# EasyEDA Pro project 辅助电源.epro, board 50W功率平板变压器
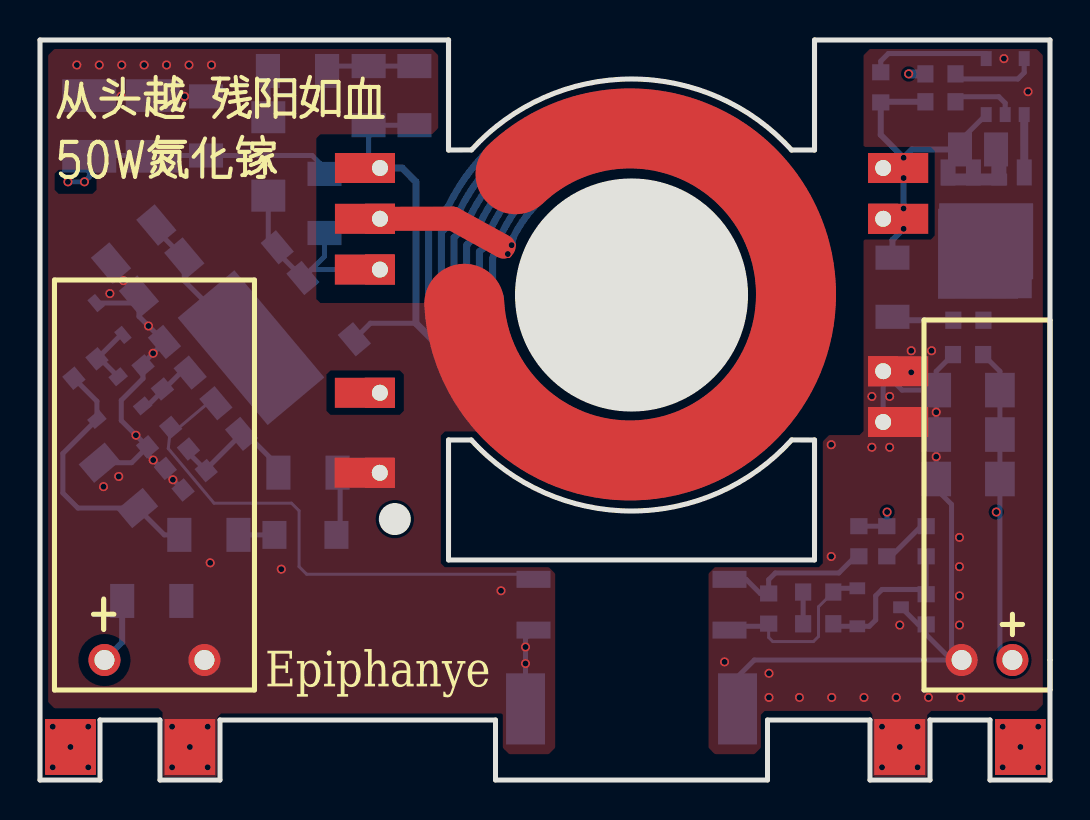
[diagram p5: board, top side]
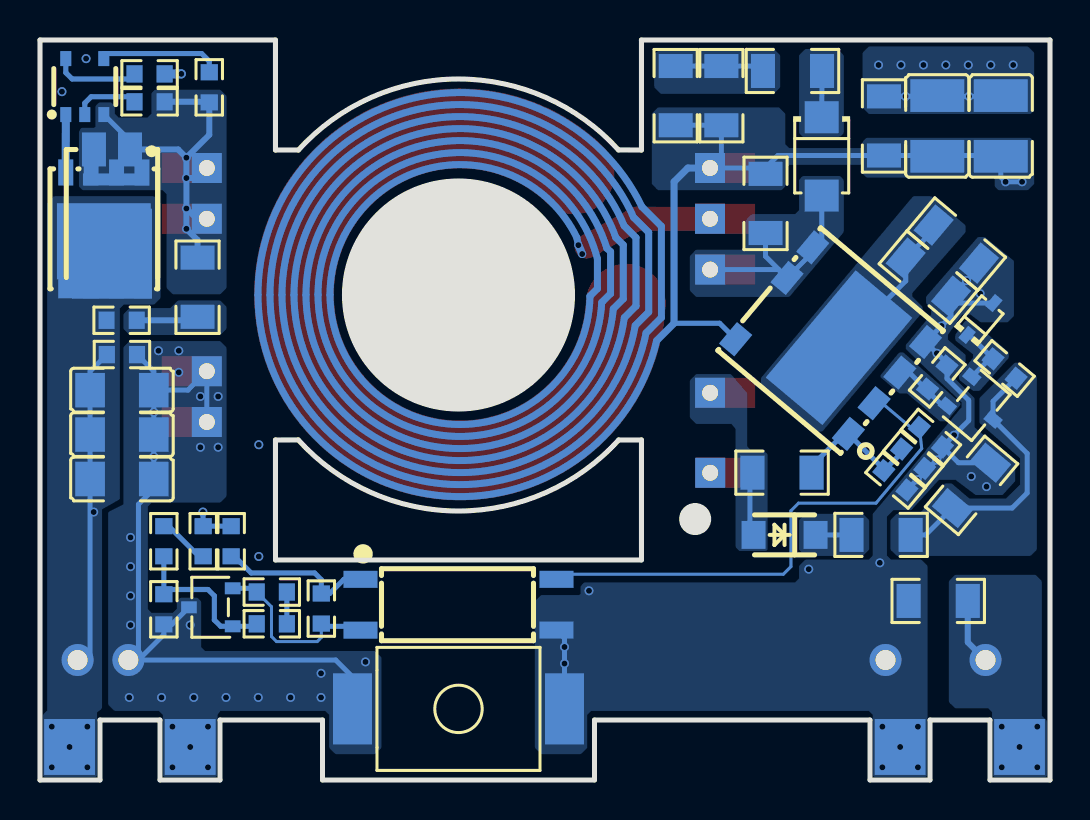
[diagram p6: board, bottom side, seen from below]

Outline 50.5 x 37 mm; copper layers: Top Layer, Inner1, Inner2, Bottom Layer. Coordinates in mm from the lower left corner of the outline.
Outline path: 20.43,37 0,37 0,0 3,0 3,3 6,3 6,0 9,0 9,3 22.78,3 22.78,0 36.38,0 36.38,3 41.5,3 41.5,0 44.5,0 44.5,3 47.5,3 47.5,0 50.5,0 50.5,37 38.73,37 ; 20.43,11.5 20.43,11 38.73,11 38.73,11.5
Stack: Top Layer 0.035mm / Dielectric1 0.48mm PP er 4.5 / Inner1 0.035mm / Dielectric2 0.48mm FR4 er 4.5 / Inner2 0.035mm / Dielectric3 0.48mm PP er 4.5 / Bottom Layer 0.035mm

## Design rules (mm)
spacing Default (default): track to track 0.25, other pairs 0 to 0.25
spacing Plane_Default: track to track 0.25, other pairs 0 to 0.25
spacing Copper_Default: track to track 0.25, other pairs 0 to 0.25
spacing Copper_gge74955: track to track 0.25, other pairs 0 to 0.25
spacing Copper_gge74970: track to track 0.25, other pairs 0 to 0.25
spacing Copper_gge74979: track to track 0.25, other pairs 0 to 0.25
spacing Copper_gge75000: track to track 0.25, other pairs 0 to 0.25
spacing Copper_gge75132: track to track 0.25, other pairs 0 to 0.25
spacing Copper_gge75177: track to track 0.25, other pairs 0 to 0.25
spacing Copper_gge75204: track to track 0.25, other pairs 0 to 0.25
spacing Copper_gge75213: track to track 0.25, other pairs 0 to 0.25
spacing Copper_gge75222: track to track 0.25, other pairs 0 to 0.25
spacing Copper_gge75285: track to track 0.25, other pairs 0 to 0.25
spacing Copper_gge75324: track to track 0.25, other pairs 0 to 0.25
spacing Copper_gge75474: track to track 0.25, other pairs 0 to 0.25
spacing Copper_gge75489: track to track 0.25, other pairs 0 to 0.25
spacing Copper_gge75615: track to track 0.25, other pairs 0 to 0.25
spacing Copper_gge90110: track to track 0.25, other pairs 0 to 0.25
spacing Copper_gge103059: track to track 0.25, other pairs 0 to 0.25
spacing Copper_gge103068: track to track 0.25, other pairs 0 to 0.25
spacing Copper_gge103143: track to track 0.25, other pairs 0 to 0.25
spacing Copper_gge82110: track to track 0.25, other pairs 0 to 0.25
spacing Copper_gge75918: track to track 0.25, other pairs 0 to 0.25
spacing Copper_gge83123: track to track 0.25, other pairs 0 to 0.25
spacing Copper_gge82110(1): track to track 0.25, other pairs 0 to 0.25
spacing Copper_gge75918(1): track to track 0.25, other pairs 0 to 0.25
spacing Copper_gge75918(2): track to track 0.25, other pairs 0 to 0.25
spacing Copper_gge82110(2): track to track 0.25, other pairs 0 to 0.25
track width Default (default): min 0.15, default 0.15, max 25.4
differential pair differentialPair (default): width min 0.127, default 0.254, max 2.54; gap min 0.152, default 0.152
pour e511 uses Copper_Default, gge74955
pour e513 uses Copper_Default, gge74970
pour e515 uses Copper_Default, gge74979
pour e517 uses Copper_Default, gge75000
pour e522 uses Copper_Default, gge75132
pour e526 uses Copper_Default, gge75177
pour e528 uses Copper_Default, gge75204
pour e530 uses Copper_Default, gge75213
pour e534 uses Copper_Default, gge75222
pour e536 uses Copper_Default, gge75285
pour e538 uses Copper_Default, gge75324
pour e544 uses Copper_Default, gge75474
pour e549 uses Copper_Default, gge75489
pour e560 uses Copper_Default, gge75615
pour e566 uses Copper_Default, gge90110
pour e568 uses Copper_Default, gge103059
pour e570 uses Copper_Default, gge103068
pour e578 uses Copper_Default, gge103143
pour e579 uses Copper_Default, gge82110
pour e588 uses Copper_Default, gge75918
pour e600 uses Copper_Default, gge83123
pour e606 uses Copper_Default, gge82110(1)
pour e616 uses Copper_Default, gge75918(1)
pour e628 uses Copper_Default, gge75918(2)
pour e640 uses Copper_Default, gge82110(2)

## Placement (name value [footprint] x y rotation side)
C4  33uF  [CAP-TH_BD10.0-P5.00-D1.0-FD-H18.8]  5.72 6 0 top
C5  470nF  [C1210]  2.46 32.7 270 bottom
C6  470nF  [C1210]  5.64 32.7 270 bottom
C7  1nF  [R0603]  46.42 22.99 180 bottom
C8  10uF  [C1206]  46.4 17.27 0 bottom
C9  10uF  [C1206]  46.4 19.49 0 bottom
C10  10uF  [C1206]  46.4 15.05 0 bottom
C11  1uF  [R0603]  46.4 21.27 180 bottom
C12  1nF  [R1206]  18.72 34.22 270 bottom
C13  22pF  [R1206]  14.22 28.83 90 bottom
C14  4.7uF  [R0603]  45.02 33.91 0 bottom
C15  680uF  [CAP-TH_BD6.3-P2.50-D1.0]  47.35 6 180 top
C16  1nF  [R0603]  5.95 17.14 220 bottom
C17  100nF  [R0603]  38.91 9.4 180 bottom
C18  NC  [R0603]  6.84 16.07 40 bottom
C19  10uF  [R0603]  5.64 20.13 310 bottom
D1  DK5V100R10S  [SM-7_L5.6-W4.1_DK5V100R10S]  46.9 28.92 90 bottom
D2  S2MF  [SMAF_L3.5-W2.6-LS4.7-RD]  11.41 31.18 270 bottom
D3  FR107W  [SOD-123FL_L2.8-W1.8-LS3.6-RD]  13.27 12.26 0 bottom
NOREF  -  [Pad_e96]  16.24 25.52 180 top
NOREF#2  -  [Pad_e94]  16.25 30.6 180 top
NOREF#3  -  [Pad_e92]  42.91 20.44 0 top
NOREF#4  -  [Pad_e82]  42.99 1.65 0 top
NOREF#5  -  [Pad_e98]  16.24 15.36 180 top
NOREF#6  -  [Pad_e84]  7.49 1.65 0 top
NOREF#7  -  [Pad_e87]  42.99 1.65 0 top
NOREF#8  -  [Pad_e93]  42.91 17.9 0 top
NOREF#9  -  [Pad_e88]  1.52 1.65 0 top
NOREF#10  -  [Pad_e85]  1.52 1.65 0 top
NOREF#11  -  [Pad_e91]  42.91 28.06 0 top
NOREF#12  -  [Pad_e95]  16.25 28.06 180 top
NOREF#13  -  [Pad_e97]  16.24 19.36 180 top
NOREF#14  -  [Pad_e90]  42.91 30.6 0 top
NOREF#15  -  [Pad_e89]  7.49 1.65 0 top
NOREF#16  -  [Pad_e83]  49.02 1.65 0 top
NOREF#17  -  [Pad_e86]  49.02 1.65 0 top
Q1  SS8050  [SOT-23-3_L2.9-W1.8-P1.90-LS2.4-BR]  3.68 18.73 40 bottom
R3  1MΩ  [R1206]  5.59 8.95 180 bottom
R4  1MΩ  [R1206]  8.3 32.7 270 bottom
R6  22Ω  [R1206]  42.62 24.64 270 bottom
R7  250kΩ  [R1206]  16.43 34.22 270 bottom
R8  20kΩ  [R0603]  42.04 34.63 270 bottom
R9  22Ω  [R1206]  12.88 35.45 180 bottom
R10  2.2Ω  [R0603]  45.02 35.31 180 bottom
R11  2.2kΩ  [R0603]  40.94 11.94 90 bottom
R12  4.7kΩ  [R0603]  36.43 8.57 90 bottom
R13  42.2kΩ  [R0603]  42.34 11.94 90 bottom
R14  10kΩ  [R0603]  38.91 7.81 180 bottom
R15  100kΩ  [R0603]  44.31 11.94 90 bottom
R16  20kΩ  [R0603]  44.31 8.53 90 bottom
R17  4.7Ω  [R1206]  8.45 12.26 180 bottom
R18  20kΩ  [R0603]  2.27 20.57 220 bottom
R19  330kΩ  [R1206]  13.4 15.37 0 bottom
R20  750mΩ  [R1206]  6.08 25.15 40 bottom
R21  560mΩ  [R1206]  4.68 26.8 40 bottom
R22  27kΩ  [R0603]  7.73 14.99 40 bottom
U2  1nF  [CAP-SMD_L8.0-W6.0-LS11.4]  29.58 3.56 180 bottom
U3  CJAC80SN10  [PG-TDSON-8-L5.5-W5.2-P1.27-LS6.4-BL]  47.31 27.56 0 bottom
U4  50W 平面变压器  [EQ2510_PCB]  29.58 24.25 0 top
U5  LP35116P  [PG-SOT23-5_L2.9-W1.6-P0.95-LS2.8-BR]  48.26 34.67 270 bottom
U6  EL1019(TA)-VG  [SOP-4_L7.5-W3.8-P2.54-LS10.2-TL]  29.58 8.76 180 bottom
U7  TL431  [SOT-23-3_L2.9-W1.8-P1.90-LS2.4-BR]  41.96 8.64 180 bottom
U8  DK065G  [PQFN-8_L8.0-W8.0_DK065G]  10.97 21.97 130 bottom
U9  10uF  [R1206]  3.92 14.73 310 bottom
Z1  BZT52C12V  [SOD-323_L1.7-W1.3-LS2.5-FD]  3.48 23.05 310 bottom

## Footprints (pads in the part's own frame, mm; a bottom-side part is the same pattern mirrored in y, then rotated)
C1206
  rect 1.485x1.728 smd: 1(-1.593,0) 2(1.593,0)
C1210
  rect 1.635x2.7 smd: 1(-1.518,0) 2(1.518,0)
CAP-SMD_L8.0-W6.0-LS11.4
  rect 1.95x3.556 smd: 1(-5.3,0) 2(5.3,0)
CAP-TH_BD6.3-P2.50-D1.0
  round 1.6 hole 1: 1(-1.27,0) 2(1.27,0)
CAP-TH_BD10.0-P5.00-D1.0-FD-H18.8
  round 1.6 hole 1: 1(-2.5,0) 2(2.5,0)
EQ2510_PCB
  rect 1.5x1.5 hole 0.8: 1(-12.576,6.351) 2(-12.576,3.811) 3(-12.581,1.271) 4(-12.586,-8.889) 5(-12.581,-4.889) 6(12.582,-6.349) 7(12.582,-3.809) 8(12.582,3.811) 9(12.582,6.351)
Pad_e82
  rect 2.54x2.794 smd far side: 1(0,0)
Pad_e83
  rect 2.54x2.794 smd far side: 1(0,0)
Pad_e84
  rect 2.54x2.794 smd far side: 1(0,0)
Pad_e85
  rect 2.54x2.794 smd far side: 1(0,0)
Pad_e86
  rect 2.54x2.794 smd: 1(0,0)
Pad_e87
  rect 2.54x2.794 smd: 1(0,0)
Pad_e88
  rect 2.54x2.794 smd: 1(0,0)
Pad_e89
  rect 2.54x2.794 smd: 1(0,0)
Pad_e90
  rect 3x1.5 smd: 3(0,0)
Pad_e91
  rect 3x1.5 smd: 3(0,0)
Pad_e92
  rect 3x1.5 smd: 3(0,0)
Pad_e93
  rect 3x1.5 smd: 3(0,0)
Pad_e94
  rect 3x1.5 smd: 3(0,0)
Pad_e95
  rect 3x1.5 smd: 3(0,0)
Pad_e96
  rect 3x1.5 smd: 3(0,0)
Pad_e97
  rect 3x1.5 smd: 3(0,0)
Pad_e98
  rect 3x1.5 smd: 3(0,0)
PG-SOT23-5_L2.9-W1.6-P0.95-LS2.8-BR
  rect 0.75x0.55 smd: 1(1.4,-0.95) 2(1.4,0) 3(1.4,0.95) 4(-1.4,0.95) 5(-1.4,-0.95)
PG-TDSON-8-L5.5-W5.2-P1.27-LS6.4-BL
  rect 0.75x1.3 smd: 1(-1.905,-2.82) 2(-0.635,-2.82) 3(0.635,-2.82) 4(1.905,-2.82) 5(1.905,2.82) 6(0.635,2.82) 7(-0.635,2.82) 8(-1.905,2.82)
  rect 3.3x0.6 smd: 3(-0.6,-2.469)
  rect 4.699x3.8 smd: 8(0,0.62)
PQFN-8_L8.0-W8.0_DK065G
  rect 1.4x1 smd: 1(-3,-3.68) 2(-1,-3.68) 3(1,-3.68) 4(3,-3.68) 5(3,3.68) 6(1,3.68) 7(-3,3.68)
  rect 7x3.7 smd: 8(0,-0.55)
R0603
  rect 0.806x0.864 smd: 1(-0.753,0) 2(0.753,0)
R1206
  rect 1.208x1.701 smd: 1(-1.479,0) 2(1.479,0)
SM-7_L5.6-W4.1_DK5V100R10S
  rect 1.7x1.2 smd: 1(2.607,-0.901) 1(2.607,0.901)
  rect 4.5x4 smd: 2(-2.607,0)
SMAF_L3.5-W2.6-LS4.7-RD
  rect 1.6x1.7 smd: 1(-1.96,0) 2(1.96,0)
SOD-123FL_L2.8-W1.8-LS3.6-RD
  rect 1.2x1.4 smd: 1(-1.55,0) 2(1.55,0)
SOD-323_L1.7-W1.3-LS2.5-FD
  rect 0.78x0.5 smd: 1(-1.04,0) 2(1.04,0)
SOP-4_L7.5-W3.8-P2.54-LS10.2-TL
  rect 1.7x0.85 smd: 1(-4.9,1.27) 2(-4.9,-1.27) 3(4.9,-1.27) 4(4.9,1.27)
SOT-23-3_L2.9-W1.8-P1.90-LS2.4-BR
  rect 0.785x0.595 smd: 1(1.093,-0.95) 2(1.093,0.95) 3(-1.093,0)

## Nets
+12V: NOREF#17.1
+20V: C7.1 C8.2 C9.2 C10.2 C11.1 C15.1 D1.2 NOREF#16.1 R10.2 R11.2 R13.2 U3.5 U3.6 U3.7 U3.8
+330V: C4.1 C5.2 C6.2 C12.2 C13.2 NOREF#2.3 NOREF#9.1 NOREF#10.1 NOREF#12.3 R3.2 R4.2 R7.2 U4.1 U4.2 U8.7
GND: C8.1 C9.1 C10.1 C11.2 C15.2 NOREF#3.3 NOREF#4.1 NOREF#7.1 NOREF#8.3 R16.1 U2.1 U4.6 U4.7 U7.3
PGND: C4.2 C5.1 C6.1 C16.2 C18.1 C19.1 D3.2 NOREF#5.3 NOREF#6.1 NOREF#13.3 NOREF#15.1 R3.1 R4.1 R19.2 R20.1 R21.1 R22.1 U2.2 U4.4 U4.5 U6.3 U8.4 U9.1 Z1.1
+SW: C13.1 D2.2 NOREF.3 U4.3 U8.5 U8.6
C7_2: C7.2 R6.2
C17_1: C17.1 R12.1 U6.2 U7.2
COMP: C16.1 U6.4 U8.2
FB_SET: R14.1 R15.1 R16.2 U7.1
Q1_1: Q1.1 R18.1 Z1.2
Q1_3: Q1.3 R17.2 R18.2 U9.2
R9_1: C12.1 R7.1 R9.1
R9_2: D2.1 R9.2
R14_2: C17.2 R14.2
R15_2: R13.1 R15.2
R17_1: D3.1 R17.1
U3_4: U3.4 U5.1
U4_8: C14.1 D1.1 NOREF#11.3 NOREF#14.3 R6.1 R8.2 U3.1 U3.2 U3.3 U4.8 U4.9 U5.3
U5_2: C14.2 U5.2
U5_4: R8.1 U5.4
U5_5: R10.1 U5.5
U6_1: R11.1 R12.2 U6.1
U8_1: C18.2 R19.1 R22.2 U8.1
U8_3: C19.2 Q1.2 U8.3
U8_8: R20.2 R21.2 U8.8

## Via types
v1: diameter 0.45, hole 0.3, Top Layer to Bottom Layer, 79 vias
v2: diameter 0.4, hole 0.3, Top Layer to Bottom Layer, 2 vias

## Routing (per net, layer and track width the routed paths; a pad name or vN(x,y) marks a point on that pad's centre or on a via; arc(x,y) is an arc through that point)
+20V: length 50.1
  Inner1 w0.254: v1(42.35,13.4) v1(47.82,13.4) 47.82,34.8 47.31,35.31 v1(43.43,35.31)
  Bottom Layer w0.25: R13.2 R11.2 ; 48.12,6 48,6.12 C10.2 48,20.43 C11.1
  Bottom Layer w0.254: v1(42.35,13.4) R13.2
  Bottom Layer w0.45: v1(43.43,35.31) R10.2
  vias: v1(48.13,2.67) v1(48.13,0.64) v1(49.02,1.65) v1(49.91,2.67) v1(49.91,0.64)
+330V: length 807.5
  Top Layer w0.4: 23.39,26.3 23.58,26.74
  Top Layer w1.2: U4.2 20.64,28.07 23.18,26.67
  Inner1 w0.35: U4.1 18.1,30.6 18.8,29.91 18.8,22.84 19.67,21.97 ; 23.66,27.13 23.58,26.74 ; 23,24.19 22.63,24.57 22.63,26.06 arc(30.4,31.31) 36.6,24.27 ; 21.83,23.56 21.34,24.06 21.34,26.75 21.7,27.12 arc(30.95,32.44) 37.8,24.27 arc(30.08,15.99) 21.28,23.12 20.7,23.7 20.7,27.11 21.29,27.71 arc(31.25,33) 38.4,24.27 arc(30.27,15.4) 20.74,22.73 20.07,23.4 20.07,27.38 20.82,28.13 arc(31.47,33.56) 39,24.27 arc(30.46,14.82) 20.2,22.35 19.43,23.12 19.43,27.69 20.41,28.66 arc(31.75,34.12) 39.6,24.27 arc(30.66,14.24) 19.67,21.97 ; 36.6,24.28 arc(29.7,17.18) 22.41,23.88 21.97,24.32 21.97,26.42 22.16,26.59 arc(30.67,31.88) 37.2,24.27 arc(29.86,16.58) 21.83,23.56 ; 23,24.19 arc(29.54,17.78) 36,24.27 arc(30.97,30.6) 23.66,27.13
  Inner1 w0.4: C4.1 1.4,7.83 v1(1.4,29.91) v1(2.22,29.91) ; 23.58,26.74 23.39,26.3
  Bottom Layer w0.25: 18.72,32.74 R7.2 16.43,31.17 U4.1 14.52,30.6 C13.2 14.22,30.61 13.61,31.22 R4.2 2.5,31.22 C5.2 2.46,30.15 v1(2.22,29.91) v1(1.4,29.91)
  Bottom Layer w0.254: 18.8,22.84 16.52,22.84 U8.7
  Bottom Layer w0.3: C4.1 4.11,6.89 R3.2
  Bottom Layer w0.35: 21.29,27.71 20.7,27.11 20.7,23.7 21.28,23.12 arc(30.08,15.99) 37.8,24.27 arc(30.95,32.44) 21.71,27.12 21.34,26.75 21.34,24.06 21.83,23.56 arc(29.86,16.58) 37.2,24.27 arc(30.67,31.88) 22.16,26.59 ; 20.82,28.13 20.07,27.38 20.07,23.4 20.74,22.73 arc(30.27,15.4) 38.4,24.27 arc(31.25,33) 21.29,27.7 ; 20.41,28.66 19.43,27.69 19.43,23.12 20.2,22.35 arc(30.46,14.82) 39,24.27 arc(31.48,33.56) 20.82,28.13 ; 22.16,26.59 21.97,26.42 21.97,24.32 22.41,23.88 arc(29.7,17.18) 36.6,24.28 ; 19.67,21.97 18.8,22.84 18.8,29.91 18.1,30.6 U4.1 ; 23.66,27.13 23.58,26.74 ; 19.67,21.97 arc(30.66,14.24) 39.6,24.27 ; 36.6,24.27 arc(30.4,31.31) 22.63,26.06 22.63,24.57 23,24.19 arc(29.54,17.78) 36,24.27 arc(30.97,30.6) 23.66,27.13 ; 39.6,24.27 arc(31.75,34.12) 20.41,28.66
  Bottom Layer w0.4: 23.58,26.74 23.39,26.3
  vias: v1(0.64,2.67) v1(0.64,0.64) v1(1.52,1.65) v1(2.41,2.67) v1(2.41,0.64) v2(23.39,26.3) v2(23.58,26.74)
GND: length 38.1
  Bottom Layer w0.25: U2.1 34.88,5.16 35.72,6 45.58,6 ; 44.81,19.49 v1(44.81,18.39) v1(44.81,16.17) 44.81,14.55 45.58,13.78 45.58,6 ; 44.81,19.49 43.1,19.49 U4.7 U4.6 ; 44.81,19.49 44.81,20.43 C11.2 ; 43.05,8.64 43.9,7.78 44.31,7.78 44.31,7.27 45.58,6
  vias: v1(34.23,5.91) v1(36.45,5.33) v1(36.45,4.13) v1(37.97,4.13) v1(39.56,16.76) v1(39.56,11.18) v1(39.59,4.13) v1(41.2,4.13) v1(41.59,19.18) v1(41.59,16.64) v1(42.1,2.67) v1(42.1,0.64) v1(42.48,19.18) v1(42.48,16.64) v1(42.81,4.13) v1(42.99,7.75) v1(42.99,1.65) v1(43.56,21.46) v1(43.56,20.38) v1(43.88,2.67) v1(43.88,0.64) v1(44.42,4.13) v1(44.58,21.46) v1(45.97,12.13) v1(45.97,10.67) v1(45.97,9.21) v1(45.97,7.75) v1(46.04,4.13) v1(48.2,36.07) v1(49.4,34.42)
PGND: length 435.8
  Top Layer w4: 21.21,23.81 arc(29.73,15.98) 37.8,24.28 arc(32.77,31.91) 23.78,30.29
  Inner2 w0.2: 19.94,24.26 19.94,22.67 19.56,22.29 15.88,22.29 14.6,21.02 14.6,17.78 15.37,17.02 18.48,17.02 20.31,18.84 23.16,18.84 arc(32.4,16.44) 37.85,24.28 arc(29.49,32.63) 21.15,24.26 ; 21.95,24.18 21.95,21.51 21.4,20.95 16.45,20.95 15.81,20.32 15.81,18.48 16.13,18.16 17.91,18.16 19.76,20.01 23.76,20.01 ; U4.5 18.41,19.36 19.56,20.51 21.78,20.51 22.35,21.08 22.35,24.13 arc(29.43,31.43) 36.65,24.28 arc(31.75,17.49) 23.76,20.01 ; 21.15,24.26 21.15,22.23 20.76,21.84 16.07,21.84 14.99,20.76 14.99,18.03 15.62,17.4 18.29,17.4 20.12,19.23 23.36,19.23 arc(32.18,16.79) 37.45,24.28 arc(29.49,32.23) 21.55,24.26 21.55,21.87 21.08,21.4 16.26,21.4 15.37,20.51 15.37,18.29 15.88,17.78 18.1,17.78 19.94,19.62 23.56,19.62 arc(31.96,17.14) 37.05,24.28 arc(29.46,31.83) 21.95,24.18
  Inner2 w0.4: v1(3.49,24.32) 3.52,24.32 4.17,24.97 ; v1(5.66,16) v1(6.64,15.01) 6.99,15.36 U4.4 ; v1(5.66,16) 4.84,15.18 v1(3.94,15.18) 3.43,14.67 v1(3.17,14.67) ; v1(5.66,16) 5.66,16.38 v1(4.8,17.24) 5.66,18.1 v1(5.66,21.34) 5.42,21.57 v1(5.42,22.7) 4.17,23.95 v1(4.17,24.97) ; v1(1.84,35.75) v1(8.57,35.75)
  Inner2 w0.6: U4.4 19.11,15.36 19.62,15.88 19.62,17.21 20.32,17.91 22.43,17.91 22.71,17.63
  Inner2 w1.65: 20,24.26 arc(29.49,33.78) 39,24.28 arc(33.09,15.48) 22.71,17.63
  Bottom Layer w0.25: 15.01,12.26 15.01,15.24 R19.2 ; R4.1 v1(7.23,34.18) v1(4.05,34.18) 2.5,34.18 C5.1 ; R22.1 v1(6.64,15.01) v1(5.66,16) 5.38,16.28 C16.2 ; U9.1 4.58,15.86 C16.2 ; Z1.1 4.6,23.85 R20.1 ; R20.1 v1(4.17,24.97) 3.55,25.59 3.55,25.85 ; R20.1 4.95,23.18 v1(5.42,22.7) 6.22,21.9 v1(5.66,21.34) 5.15,20.83 C19.1 5.15,20.07 4.06,18.99 4.06,17.97 v1(4.8,17.24) C16.2 ; 24.68,7.49 24.28,7.09 v1(24.28,5.82) U2.2
  vias: v1(2.96,35.75) v1(4.08,35.75) v1(5.21,35.75) v1(6.33,35.75) v1(6.6,2.67) v1(6.6,0.64) v1(7.45,35.75) v1(7.49,1.65) v1(8.38,2.67) v1(8.38,0.64) v1(8.51,10.86) v1(12.06,10.54) v1(23.05,9.46) v1(24.28,6.65)
+SW: length 11.5
  Bottom Layer w0.25: D2.2 11.41,27.08 11.86,26.63 11.86,26.39 U8.6 ; U8.6 14.22,26.18 C13.1 ; U8.6 13.56,25.52 16.99,25.52
C7_2: length 3.1
  Bottom Layer w0.3: C7.2 42.8,22.99 42.62,23.16
C17_1: length 9.4
  Bottom Layer w0.15: 36.43,7.82 36.43,7.13 36.64,6.92 38.67,6.92 38.93,7.18 38.93,8.66 39.66,9.4
  Bottom Layer w0.25: C17.1 39.85,9.59 U7.2 ; 36.43,7.82 36.43,7.68 34.67,7.68 34.48,7.49
COMP: length 26.7
  Bottom Layer w0.15: U8.2 8.36,18.81 6.96,17.63 6.53,17.63 6.41,16.57 8.7,13.84 12.57,13.84 12.95,13.46 12.95,10.67 13.34,10.29 24.68,10.29 24.68,10.03
FB_SET: length 8.3
  Bottom Layer w0.25: U7.1 39.79,7.69 R14.1 ; R15.1 R16.2
  Bottom Layer w0.254: U7.1 41.46,7.69 41.78,8 41.78,9.21 42.1,9.53 44.31,9.53 R16.2
Q1_1: length 3.2
  Bottom Layer w0.25: Q1.1 3.01,21.06 R18.1 4.04,22.25 Z1.2
Q1_3: length 13.6
  Bottom Layer w0.25: R18.2 2.85,18.94 Q1.3 1.14,16.33 1.14,14.35 1.89,13.6 U9.2 6.22,12.26 R17.2
R9_1: length 4.5
  Bottom Layer w0.25: 18.72,35.7 R7.1 14.6,35.7 14.35,35.45
R9_2: length 2.3
  Bottom Layer w0.25: R9.2 11.41,33.14
R14_2: length 1.6
  Bottom Layer w0.25: R14.2 C17.2
R15_2: length 2.6
  Bottom Layer w0.25: R13.1 42.55,11.18 44.06,12.69 R15.2
R17_1: length 1.6
  Bottom Layer w0.25: R17.1 11.54,12.26
U3_4: length 2.9
  Bottom Layer w0.4: 49.21,33.27 49.21,30.38
U4_8: length 18.5
  Bottom Layer w0.254: U5.3 46,31.96 D1.1
  Bottom Layer w0.3: v1(43.18,30.1) 42.66,30.1 U4.9 ; v1(43.18,31.11) 43.59,31.53 D1.1 ; v1(43.18,31.11) 42.04,32.26 R8.2 42.07,33.91 C14.1 ; v1(43.18,31.11) v1(43.18,27.56) 42.62,27 R6.1 ; v1(43.18,28.58) 42.66,28.06 U4.8
U5_2: length 3.4
  Bottom Layer w0.254: C14.2 45.78,34.16 47.94,34.16 48.26,33.85 48.26,33.27
U5_4: length 6.2
  Bottom Layer w0.254: U5.4 47.31,36.32 42.42,36.32 42.04,35.94 42.04,35.39
U5_5: length 4.5
  Bottom Layer w0.254: R10.1 45.78,35.05 48.9,35.05 49.21,35.37 U5.5
U6_1: length 7.9
  Bottom Layer w0.25: R11.1 40.77,11.18 39.94,10.35 36.77,10.35 36.43,10.02 36.43,9.33 36.01,9.33 35.31,10.03 34.48,10.03
U8_1: length 6.9
  Bottom Layer w0.25: C18.2 7.42,16.36 8.31,15.47 8.31,15.54 U8.1 ; 10.14,17.48 11.92,15.7 R19.1
U8_3: length 3.1
  Bottom Layer w0.25: Q1.2 5.37,18.71 7.04,20.37 U8.3
U8_8: length 8.1
  Bottom Layer w0.25: 10.55,21.62 7.21,24.95 R20.2 5.82,27.49 R21.2

## Copper pours and planes (outline as drawn; the poured copper is in the pictures)
+12V on Bottom Layer: 44.7,34.8 44.83,34.92 44.83,35.69 44.7,35.81 43.31,35.81 43.18,35.69 43.18,34.92 43.31,34.8
+20V on Bottom Layer: 44.58,28.83 44.58,24.13 44.83,23.88 46.35,23.88 46.61,23.62 46.61,14.1 47.5,13.59 47.5,3.62 47.75,3.43 47.75,0.25 50.29,0.25 50.29,3.17 50.04,3.43 50.04,28.83 49.78,29.08 44.83,29.08
+330V on Bottom Layer: 0.76,10.16 0.51,9.91 0.51,3.17 0.25,2.92 0.25,0.25 2.79,0.25 2.79,3.43 3.05,3.68 4.7,3.68 4.95,3.94 4.95,9.91 4.7,10.16
+330V on Bottom Layer: 1.02,32 0.89,31.88 0.89,29.84 1.14,29.59 2.54,29.59 2.67,29.72 2.67,30.1 2.79,30.23 9.14,30.23 9.27,30.35 9.27,30.73 9.4,30.86 13.08,30.86 13.34,30.61 13.34,29.72 13.46,29.59 19.56,29.59 19.81,29.84 19.81,33.27 19.56,33.53 13.59,33.53 13.34,33.27 13.34,31.75 13.08,31.5 9.4,31.5 9.27,31.62 9.27,31.88 9.14,32
+330V on Inner1: 0.89,30.35 0.64,30.1 0.64,3.3 0.25,2.92 0.25,0.25 2.79,0.25 2.79,3.43 3.05,3.68 4.7,3.68 4.95,3.94 4.95,7.75 4.7,8 1.91,8 1.65,8.25 1.65,29.08 1.91,29.34 2.54,29.34 2.79,29.59 2.79,30.1 2.54,30.35
GND on Top Layer: 33.78,10.54 33.53,10.29 33.53,1.65 33.78,1.4 35.69,1.4 35.94,1.65 35.94,3.3 36.19,3.56 41.53,3.56 41.72,3.3 41.72,0.25 44.26,0.25 44.26,3.3 44.51,3.56 49.78,3.56 50.04,3.81 50.04,36.19 49.78,36.45 41.53,36.45 41.28,36.19 41.28,17.4 41.02,17.14 39.5,17.14 39.24,16.89 39.24,10.8 38.99,10.54
GND on Bottom Layer: 41.53,21.84 41.28,21.59 41.28,14.22 41.53,13.97 44.96,13.97 45.21,13.72 45.21,8.51 44.96,8.25 43.81,8.25 43.56,8.51 43.56,8.89 43.43,9.02 42.67,9.02 42.54,8.89 42.54,6.6 42.29,6.35 33.78,6.35 33.53,6.1 33.53,1.65 33.78,1.4 35.69,1.4 35.94,1.65 35.94,3.3 36.19,3.56 41.53,3.56 41.72,3.3 41.72,0.25 44.26,0.25 44.26,3.3 44.51,3.56 46.74,3.56 46.99,3.81 46.99,13.33 46.23,13.72 46.23,21.59 45.97,21.84
GND on Inner1: 33.78,10.54 33.53,10.29 33.53,1.65 33.78,1.4 35.69,1.4 35.94,1.65 35.94,3.3 36.19,3.56 41.53,3.56 41.72,3.3 41.72,0.25 44.26,0.25 44.26,3.3 44.51,3.56 49.78,3.56 50.04,3.81 50.04,36.19 49.78,36.45 41.53,36.45 41.28,36.19 41.28,17.4 41.02,17.14 39.5,17.14 39.24,16.89 39.24,10.8 38.99,10.54
GND on Inner2: 33.78,10.54 33.53,10.29 33.53,1.65 33.78,1.4 35.69,1.4 35.94,1.65 35.94,3.3 36.19,3.56 41.53,3.56 41.72,3.3 41.72,0.25 44.26,0.25 44.26,3.3 44.51,3.56 49.78,3.56 50.04,3.81 50.04,36.19 49.78,36.45 41.53,36.45 41.28,36.19 41.28,17.4 41.02,17.14 39.5,17.14 39.24,16.89 39.24,10.8 38.99,10.54
PGND on Top Layer: 0.51,36.19 0.51,3.94 0.76,3.68 5.97,3.68 6.22,3.43 6.22,0.25 8.76,0.25 8.76,3.17 9.02,3.43 23.11,3.43 23.24,3.3 23.24,1.65 23.5,1.4 25.4,1.4 25.65,1.65 25.65,10.29 25.4,10.54 20.19,10.54 19.94,10.8 19.94,17.27 20.19,17.53 21.84,17.53 21.84,23.75 13.97,23.75 13.72,24 13.72,32.13 13.97,32.39 19.56,32.39 19.81,32.64 19.81,36.19 19.56,36.45 0.76,36.45
PGND on Bottom Layer: 3.3,27.05 1.91,25.91 1.91,23.24 2.16,22.99 3.43,22.99 3.94,23.37 4.44,23.37 5.21,22.29 5.21,21.97 4.32,21.21 4.32,20.95 4.83,20.32 4.83,20 3.87,19.05 3.87,17.59 1.84,15.88 1.84,14.99 2.41,14.35 3.68,14.35 4.7,15.11 5.59,15.11 6.98,13.59 7.87,13.59 8.25,13.21 8.25,11.18 8,10.92 6.48,10.92 6.22,10.67 6.22,0.25 8.76,0.25 8.76,3.3 9.02,3.56 22.99,3.56 23.24,3.3 23.24,1.65 23.5,1.4 25.4,1.4 25.65,1.65 25.65,8.89 25.4,9.14 23.5,9.14 23.37,9.27 23.37,9.65 23.24,9.78 12.7,9.78 12.45,10.03 12.45,10.67 12.19,10.92 9.02,10.92 8.76,11.18 8.76,13.27 4.32,18.61 4.32,18.92 7.11,21.59 7.11,21.72 5.84,23.24 5.84,23.62 6.1,23.88 6.1,24.13 3.56,27.05
PGND on Bottom Layer: 1.14,36.58 0.89,36.32 0.89,33.53 1.02,33.4 9.02,33.4 9.27,33.66 9.27,36.32 9.02,36.58
PGND on Bottom Layer: 14.38,16.38 14.22,16.26 14.22,11.56 15.49,11.56 15.62,11.68 15.62,17.59 15.88,17.91 17.65,17.91 17.91,18.16 17.91,19.94 17.65,20.19 16,20.19 15.24,19.3 15.24,16.64 14.99,16.38
PGND on Inner1: 0.51,36.19 0.51,31.11 0.76,30.86 3.05,30.86 3.3,30.61 3.3,29.08 3.05,28.83 2.41,28.83 2.16,28.58 2.16,8.76 2.41,8.51 5.21,8.51 5.46,8.25 5.46,3.68 5.72,3.43 5.97,3.43 6.22,3.17 6.22,0.25 8.76,0.25 8.76,3.17 9.02,3.43 23.11,3.43 23.24,3.3 23.24,1.65 23.5,1.4 25.4,1.4 25.65,1.65 25.65,10.29 25.4,10.54 20.19,10.54 19.94,10.8 19.94,18.16 15.75,18.16 15.49,18.42 15.49,31.88 15.75,32.13 19.56,32.13 19.81,32.39 19.81,36.19 19.56,36.45 0.76,36.45
PGND on Inner2: 0.51,36.19 0.51,3.94 0.76,3.68 5.97,3.68 6.22,3.43 6.22,0.25 8.76,0.25 8.76,3.17 9.02,3.43 23.11,3.43 23.24,3.3 23.24,1.65 23.5,1.4 25.4,1.4 25.65,1.65 25.65,10.29 25.4,10.54 20.19,10.54 19.94,10.8 19.94,16.51 15.11,16.51 14.1,17.65 14.1,21.08 15.49,22.61 15.49,31.88 15.75,32.13 19.56,32.13 19.81,32.39 19.81,36.19 19.56,36.45 0.76,36.45
+SW on Bottom Layer: 10.54,30.1 10.41,29.97 10.41,27.43 13.08,24.26 17.65,24.26 17.91,24.51 17.91,26.16 17.65,26.42 15.37,26.42 15.11,26.67 15.11,27.94 14.86,28.19 12.7,28.19 12.45,28.45 12.45,29.97 12.32,30.1
C7_2 on Bottom Layer: 41.53,23.88 41.28,23.62 41.28,22.61 41.53,22.35 45.97,22.35 46.23,22.61 46.23,23.24 45.97,23.5 43.94,23.5 43.56,23.88
Q1_1 on Bottom Layer: 4.19,22.86 3.94,22.86 2.16,21.34 2.16,21.15 3.56,19.56 3.81,19.56 4.44,20.07 4.44,20.19 3.75,21.08 3.75,21.34 4.64,22.03 4.64,22.22
Q1_3 on Bottom Layer: 1.52,20.76 0.76,20.13 0.76,11.56 1.02,11.3 7.62,11.3 7.87,11.56 7.87,12.95 7.62,13.21 6.48,13.21 5.21,14.73 4.95,14.73 4.06,13.97 2.16,13.97 1.4,14.73 1.4,16.13 3.43,17.91 3.43,19.05 1.71,20.76
R9_1 on Bottom Layer: 13.84,36.45 13.59,36.19 13.59,34.67 13.84,34.42 19.43,34.42 19.69,34.67 19.69,36.26 19.43,36.45
R9_2 on Bottom Layer: 10.67,36.45 10.41,36.19 10.41,32.39 10.54,32.26 12.32,32.26 12.45,32.39 12.45,36.19 12.19,36.45
R17_1 on Bottom Layer: 9.4,13.21 9.14,12.95 9.14,11.56 9.4,11.3 12.19,11.3 12.45,11.56 12.45,12.95 12.19,13.21
U4_8 on Bottom Layer: 41.53,34.42 41.28,34.16 41.28,24.64 41.53,24.38 43.81,24.38 44.07,24.64 44.07,29.34 44.32,29.59 48.32,29.59 48.45,29.72 48.45,32.39 48.39,32.51 47.75,32.51 47.62,32.64 47.62,33.66 47.5,33.78 46.99,33.78 46.86,33.66 46.86,33.27 46.61,33.02 45.09,33.02 44.83,33.27 44.83,34.29 44.7,34.42
U8_3 on Bottom Layer: 7.49,21.27 7.37,21.27 4.57,18.8 5.21,18.03 5.46,18.03 7.11,19.43 7.49,19.43 8.38,20.19
U8_8 on Bottom Layer: 5.97,29.08 4.32,27.69 4.32,27.43 6.98,24.38 6.98,24.13 6.48,23.62 6.48,23.43 11.43,17.53 11.68,17.53 14.35,19.81 14.35,20.07 6.79,29.08

## Text on the board
Top Silkscreen Layer: 从头越 残阳如血 | Epiphanye | 50W氮化镓
